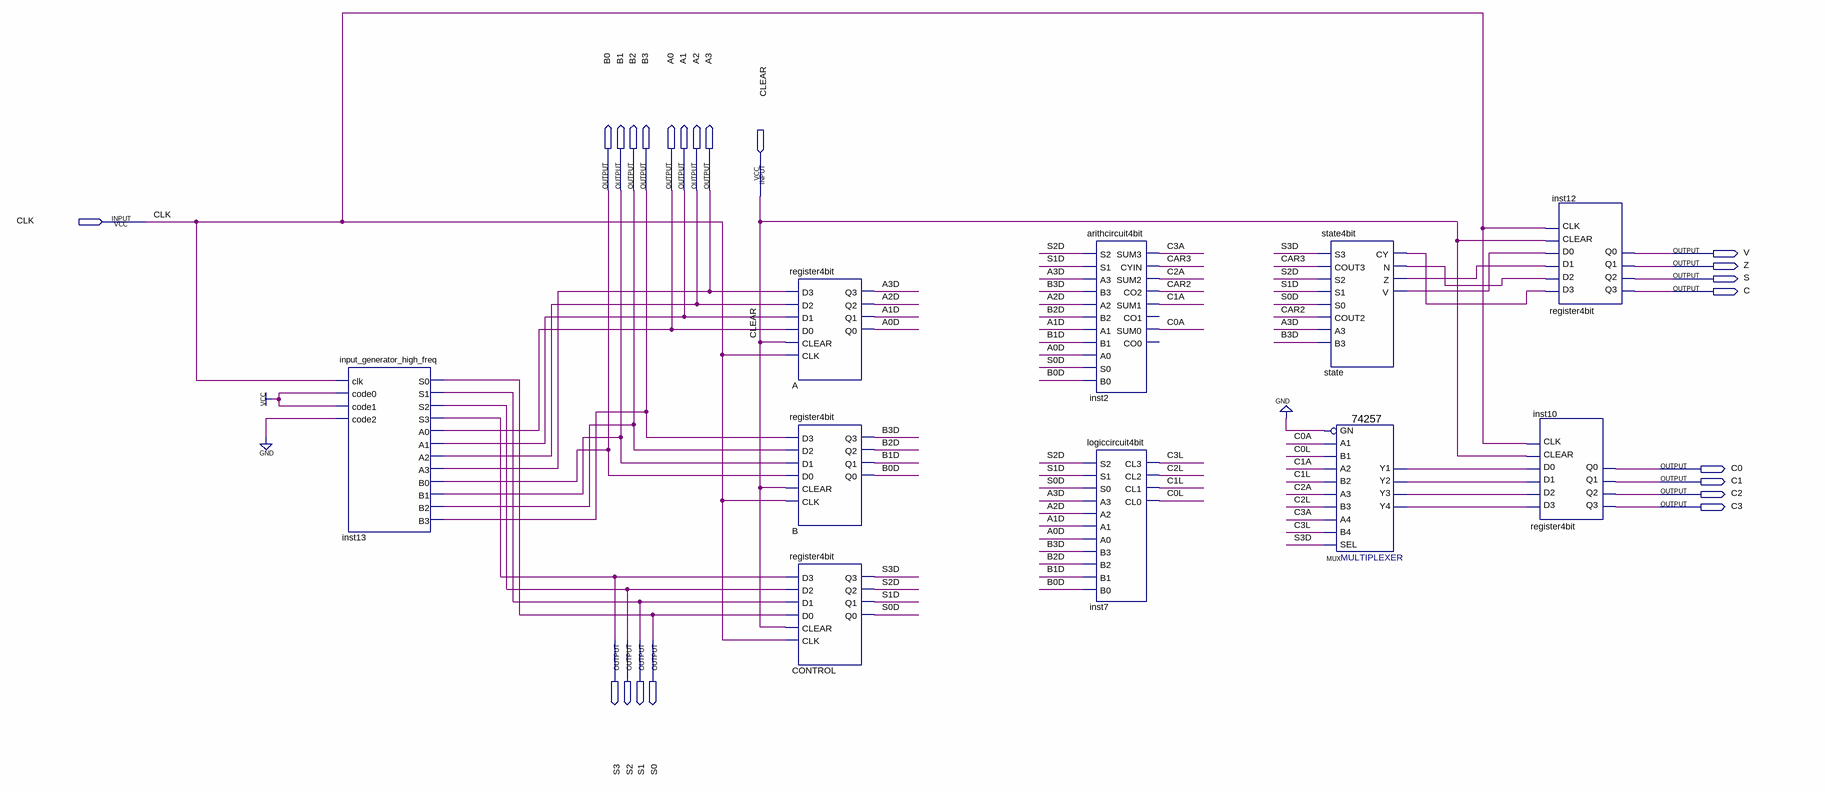
[diagram p0: schematic sheet]
// Quartus schematic Lab3_top.bdf as structural Verilog: 10 symbols, 22 pins
module Lab3_top (
  input  CLEAR,
  input  CLK,
  output B0,
  output B1,
  output B2,
  output B3,
  output A0,
  output A1,
  output A2,
  output A3,
  output V,
  output Z,
  output S,
  output C,
  output C0,
  output C1,
  output C2,
  output C3,
  output S3,
  output S2,
  output S1,
  output S0
);

  wire A0D, A1D, A2D, A3D, B0D, B1D, B2D, B3D, C0A, C0L, C1A, C1L, C2A, C2L, C3A, C3L, CAR2, CAR3, MUX_y1,
       MUX_y2, MUX_y3, MUX_y4, S0D, S1D, S2D, S3D, state_cy, state_n, state_v, state_z;

  input_generator_high_freq inst13 (
    .clk(CLK), .code0(1'b1), .code1(1'b1), .code2(1'b0), .S0(S0), .S1(S1), .S2(S2), .S3(S3), .A0(A0),
    .A1(A1), .A2(A2), .A3(A3), .B0(B0), .B1(B1), .B2(B2), .B3(B3));
  register4bit A (.D3(A3), .D2(A2), .D1(A1), .D0(A0), .CLEAR(CLEAR), .CLK(CLK), .Q3(A3D), .Q2(A2D), .Q1(A1D), .Q0(A0D));
  register4bit B (.D3(B3), .D2(B2), .D1(B1), .D0(B0), .CLEAR(CLEAR), .CLK(CLK), .Q3(B3D), .Q2(B2D), .Q1(B1D), .Q0(B0D));
  register4bit CONTROL (
    .D3(S3), .D2(S2), .D1(S1), .D0(S0), .CLEAR(CLEAR), .CLK(CLK), .Q3(S3D), .Q2(S2D), .Q1(S1D), .Q0(S0D));
  arithcircuit4bit inst2 (
    .S2(S2D), .S1(S1D), .A3(A3D), .B3(B3D), .A2(A2D), .B2(B2D), .A1(A1D), .B1(B1D), .A0(A0D), .S0(S0D),
    .B0(B0D), .SUM3(C3A), .CYIN(CAR3), .SUM2(C2A), .CO2(CAR2), .SUM1(C1A), .SUM0(C0A));  // open: CO1, CO0
  logiccircuit4bit inst7 (
    .S2(S2D), .S1(S1D), .S0(S0D), .A3(A3D), .A2(A2D), .A1(A1D), .A0(A0D), .B3(B3D), .B2(B2D), .B1(B1D),
    .B0(B0D), .CL3(C3L), .CL2(C2L), .CL1(C1L), .CL0(C0L));
  state4bit state (
    .S3(S3D), .COUT3(CAR3), .S2(S2D), .S1(S1D), .S0(S0D), .COUT2(CAR2), .A3(A3D), .B3(B3D), .CY(state_cy),
    .N(state_n), .Z(state_z), .V(state_v));
  \74257  MUX (
    .B1(C0L), .A1(C0A), .B3(C2L), .A2(C1A), .B2(C1L), .A3(C2A), .A4(C3A), .B4(C3L), .SEL(S3D), .GN(1'b0),
    .Y2(MUX_y2), .Y3(MUX_y3), .Y4(MUX_y4), .Y1(MUX_y1));
  register4bit inst12 (
    .D3(state_cy), .D2(state_n), .D1(state_z), .D0(state_v), .CLEAR(CLEAR), .CLK(CLK), .Q3(C), .Q2(S),
    .Q1(Z), .Q0(V));
  register4bit inst10 (
    .D3(MUX_y4), .D2(MUX_y3), .D1(MUX_y2), .D0(MUX_y1), .CLEAR(CLEAR), .CLK(CLK), .Q3(C3), .Q2(C2), .Q1(C1),
    .Q0(C0));
endmodule
